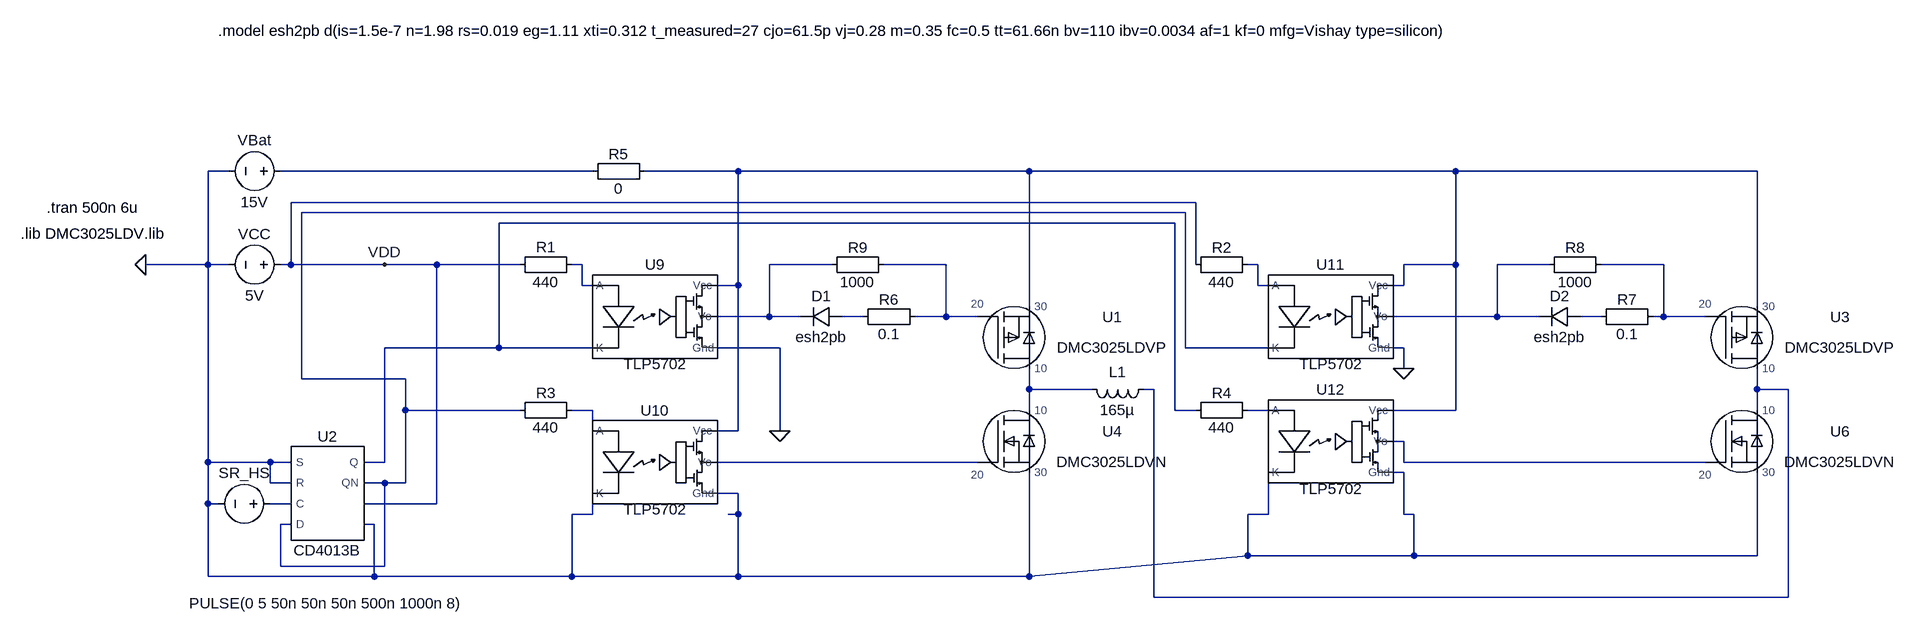
[diagram p0: schematic MosFetDriverDelayedOffPChannel.asc]
MosFetDriverDelayedOffPChannel.asc, the LTspice schematic file:
Version 4
SHEET 1 1016 792
WIRE -1552 -192 -1584 -192
WIRE -992 -192 -1472 -192
WIRE -768 -192 -912 -192
WIRE -320 -192 -768 -192
WIRE 336 -192 -320 -192
WIRE 800 -192 336 -192
WIRE -64 -144 -1456 -144
WIRE -80 -128 -1440 -128
WIRE -96 -112 -1136 -112
WIRE -1584 -48 -1584 -192
WIRE -1584 -48 -1680 -48
WIRE -1552 -48 -1584 -48
WIRE -1456 -48 -1456 -144
WIRE -1456 -48 -1472 -48
WIRE -1312 -48 -1456 -48
WIRE -1232 -48 -1312 -48
WIRE -1104 -48 -1232 -48
WIRE -1008 -48 -1024 -48
WIRE -624 -48 -720 -48
WIRE -448 -48 -544 -48
WIRE -64 -48 -64 -144
WIRE 32 -48 16 -48
WIRE 336 -48 336 -192
WIRE 336 -48 256 -48
WIRE 480 -48 400 -48
WIRE 656 -48 560 -48
WIRE -1008 -16 -1008 -48
WIRE -992 -16 -1008 -16
WIRE -768 -16 -768 -192
WIRE -768 -16 -800 -16
WIRE 32 -16 32 -48
WIRE 48 -16 32 -16
WIRE 256 -16 256 -48
WIRE 256 -16 240 -16
WIRE -320 16 -320 -192
WIRE 800 16 800 -192
WIRE -720 32 -720 -48
WIRE -720 32 -800 32
WIRE -672 32 -720 32
WIRE -576 32 -608 32
WIRE -448 32 -448 -48
WIRE -448 32 -496 32
WIRE -400 32 -448 32
WIRE 400 32 400 -48
WIRE 400 32 240 32
WIRE 464 32 400 32
WIRE 560 32 528 32
WIRE 656 32 656 -48
WIRE 656 32 640 32
WIRE 720 32 656 32
WIRE -1136 80 -1136 -112
WIRE -1136 80 -1312 80
WIRE -992 80 -1136 80
WIRE -704 80 -800 80
WIRE -80 80 -80 -128
WIRE 48 80 -80 80
WIRE 256 80 240 80
WIRE 256 112 256 80
WIRE -1440 128 -1440 -128
WIRE -1280 128 -1440 128
WIRE -320 144 -320 112
WIRE -224 144 -320 144
WIRE -128 144 -144 144
WIRE 800 144 800 112
WIRE 848 144 800 144
WIRE -1280 176 -1280 128
WIRE -1104 176 -1280 176
WIRE -992 176 -1024 176
WIRE -320 176 -320 144
WIRE -96 176 -96 -112
WIRE -64 176 -96 176
WIRE 48 176 16 176
WIRE 336 176 336 -48
WIRE 336 176 240 176
WIRE 800 176 800 144
WIRE -992 208 -992 176
WIRE -768 208 -768 -16
WIRE -768 208 -800 208
WIRE -704 208 -704 80
WIRE 256 224 240 224
WIRE -1584 256 -1584 -48
WIRE -1488 256 -1584 256
WIRE -1456 256 -1488 256
WIRE -1312 256 -1312 80
WIRE -1312 256 -1344 256
WIRE -400 256 -800 256
WIRE 256 256 256 224
WIRE 720 256 256 256
WIRE 256 272 240 272
WIRE -1488 288 -1488 256
WIRE -1456 288 -1488 288
WIRE -1312 288 -1344 288
WIRE -1280 288 -1280 176
WIRE -1280 288 -1312 288
WIRE -768 304 -800 304
WIRE -1584 320 -1584 256
WIRE -1568 320 -1584 320
WIRE -1456 320 -1488 320
WIRE -1232 320 -1232 -48
WIRE -1232 320 -1344 320
WIRE -992 336 -992 304
WIRE -992 336 -1024 336
WIRE -768 336 -768 304
WIRE -768 336 -784 336
WIRE 48 336 48 272
WIRE 48 336 16 336
WIRE 256 336 256 272
WIRE 272 336 256 336
WIRE -1456 352 -1472 352
WIRE -1328 352 -1344 352
WIRE 16 400 16 336
WIRE 272 400 272 336
WIRE 272 400 16 400
WIRE 800 400 800 272
WIRE 800 400 272 400
WIRE -1472 416 -1472 352
WIRE -1312 416 -1312 288
WIRE -1312 416 -1472 416
WIRE -1584 432 -1584 320
WIRE -1328 432 -1328 352
WIRE -1328 432 -1584 432
WIRE -1024 432 -1024 336
WIRE -1024 432 -1328 432
WIRE -768 432 -768 336
WIRE -768 432 -1024 432
WIRE -320 432 -320 272
WIRE -320 432 16 400
WIRE -320 432 -768 432
WIRE -128 464 -128 144
WIRE 848 464 848 144
WIRE 848 464 -128 464
FLAG -1680 -48 0
FLAG -704 208 0
FLAG 256 112 0
FLAG -1312 -48 VDD
SYMBOL voltage -1472 320 R90
WINDOW 3 138 -72 VTop 2
WINDOW 0 -32 56 VBottom 2
SYMATTR Value PULSE(0 5 50n 50n 50n 500n 1000n 8)
SYMATTR InstName SR_HS
SYMBOL voltage -1456 -192 R90
WINDOW 0 -32 56 VBottom 2
WINDOW 3 32 56 VTop 2
SYMATTR InstName VBat
SYMATTR Value 15V
SYMBOL Misc/EuropeanResistor -1120 -32 R270
WINDOW 0 28 56 VTop 2
WINDOW 3 5 56 VBottom 2
SYMATTR InstName R1
SYMATTR Value 440
SYMBOL Misc/EuropeanResistor -1120 192 R270
WINDOW 0 27 56 VTop 2
WINDOW 3 5 56 VBottom 2
SYMATTR InstName R3
SYMATTR Value 440
SYMBOL Misc/EuropeanResistor -80 -32 R270
WINDOW 0 27 56 VTop 2
WINDOW 3 5 56 VBottom 2
SYMATTR InstName R2
SYMATTR Value 440
SYMBOL Misc/EuropeanResistor -80 192 R270
WINDOW 0 27 56 VTop 2
WINDOW 3 5 56 VBottom 2
SYMATTR InstName R4
SYMATTR Value 440
SYMBOL ind -128 128 R90
WINDOW 0 5 56 VBottom 2
WINDOW 3 32 56 VTop 2
SYMATTR InstName L1
SYMATTR Value 165µ
SYMATTR SpiceLine Rser=3.75
SYMBOL DMP3008SFGQ -352 64 R0
SYMATTR InstName U1
SYMATTR Value DMC3025LDVP
SYMBOL DMP3008SFGQ 768 64 R0
SYMATTR InstName U3
SYMATTR Value DMC3025LDVP
SYMBOL DMN3018SFGQ -336 224 R0
SYMATTR InstName U4
SYMATTR Value DMC3025LDVN
SYMBOL DMN3018SFGQ 784 224 R0
SYMATTR InstName U6
SYMATTR Value DMC3025LDVN
SYMBOL Misc/EuropeanResistor -1008 -176 R270
WINDOW 0 27 56 VTop 2
WINDOW 3 5 56 VBottom 2
SYMATTR InstName R5
SYMATTR Value 0
SYMBOL diode -608 16 R90
WINDOW 0 0 32 VBottom 2
WINDOW 3 32 32 VTop 2
SYMATTR InstName D1
SYMATTR Value esh2pb
SYMBOL TLP5702 -896 32 R0
SYMATTR InstName U9
SYMBOL TLP5702 -896 256 R0
SYMATTR InstName U10
SYMBOL TLP5702 144 32 R0
SYMATTR InstName U11
SYMBOL TLP5702 144 224 R0
SYMATTR InstName U12
SYMBOL voltage -1456 -48 R90
WINDOW 0 -32 56 VBottom 2
WINDOW 3 32 56 VTop 2
SYMATTR InstName VCC
SYMATTR Value 5V
SYMBOL CD4013B -1408 304 R0
SYMATTR InstName U2
SYMBOL Misc/EuropeanResistor 656 16 R90
WINDOW 0 5 56 VBottom 2
WINDOW 3 27 56 VTop 2
SYMATTR InstName R7
SYMATTR Value 0.1
SYMBOL diode 528 16 R90
WINDOW 0 0 32 VBottom 2
WINDOW 3 32 32 VTop 2
SYMATTR InstName D2
SYMATTR Value esh2pb
SYMBOL Misc/EuropeanResistor 576 -64 R90
WINDOW 0 5 56 VBottom 2
WINDOW 3 27 56 VTop 2
SYMATTR InstName R8
SYMATTR Value 1000
SYMBOL Misc/EuropeanResistor -528 -64 R90
WINDOW 0 5 56 VBottom 2
WINDOW 3 27 56 VTop 2
SYMATTR InstName R9
SYMATTR Value 1000
SYMBOL Misc/EuropeanResistor -480 16 R90
WINDOW 0 5 56 VBottom 2
WINDOW 3 27 56 VTop 2
SYMATTR InstName R6
SYMATTR Value 0.1
TEXT -1832 -136 Left 2 !.tran 500n 6u
TEXT -1872 -96 Left 2 !.lib DMC3025LDV.lib
TEXT -1568 -408 Left 2 !.model esh2pb d(is=1.5e-7 n=1.98 rs=0.019 eg=1.11 xti=0.312 t_measured=27 cjo=61.5p vj=0.28 m=0.35 fc=0.5 tt=61.66n bv=110 ibv=0.0034 af=1 kf=0 mfg=Vishay type=silicon)

The netlist it stands for:
* MosFetDriverDelayedOffPChannel.asc
V§SR_HS N019 0 PULSE(0 5 50n 50n 50n 500n 1000n 8)
VBat N001 0 15V
R1 VDD N005 440
R3 N003 N015 440
R2 VDD N008 440
R4 N004 N016 440
L1 N014 N013 165µ Rser=3.75
XU1 N013 N007 N002 DMC3025LDVP  ; pins 10 20 30
XU3 N014 N010 N002 DMC3025LDVP  ; pins 10 20 30
XU4 N013 N018 0 DMC3025LDVN  ; pins 10 20 30
XU6 N014 N017 0 DMC3025LDVN  ; pins 10 20 30
R5 N001 N002 0
D1 N011 N006 esh2pb
XU9 N005 N004 0 N006 N002 TLP5702 TLP5702  ; pins A K Gnd Vo Vcc
XU10 N015 0 0 N018 N002 TLP5702 TLP5702  ; pins A K Gnd Vo Vcc
XU11 N008 N003 0 N009 N002 TLP5702 TLP5702  ; pins A K Gnd Vo Vcc
XU12 N016 0 0 N017 N002 TLP5702 TLP5702  ; pins A K Gnd Vo Vcc
VCC VDD 0 5V
XU2 0 N019 N003 0 N004 N003 VDD 0 CD4013B VDD=5.0 SPEED=0.1 TRIPDT=1e-9  ; pins S C D R Q QN
R7 N010 N012 0.1
D2 N012 N009 esh2pb
R8 N010 N009 1000
R9 N007 N006 1000
R6 N007 N011 0.1
.model D D
.lib standard.dio
.tran 500n 6u
.lib DMC3025LDV.lib
.model esh2pb d(is=1.5e-7 n=1.98 rs=0.019 eg=1.11 xti=0.312 t_measured=27 cjo=61.5p vj=0.28 m=0.35 fc=0.5 tt=61.66n bv=110 ibv=0.0034 af=1 kf=0 mfg=Vishay type=silicon)
.lib DMP3008SFGQ.lib
.lib DMN3018SFGQ.lib
.lib TLP5702.mod
.lib CD4000_v.lib
.backanno
.end